# Altium project OFP_SCM_v1.5.PrjPcb (part 1 of 2)
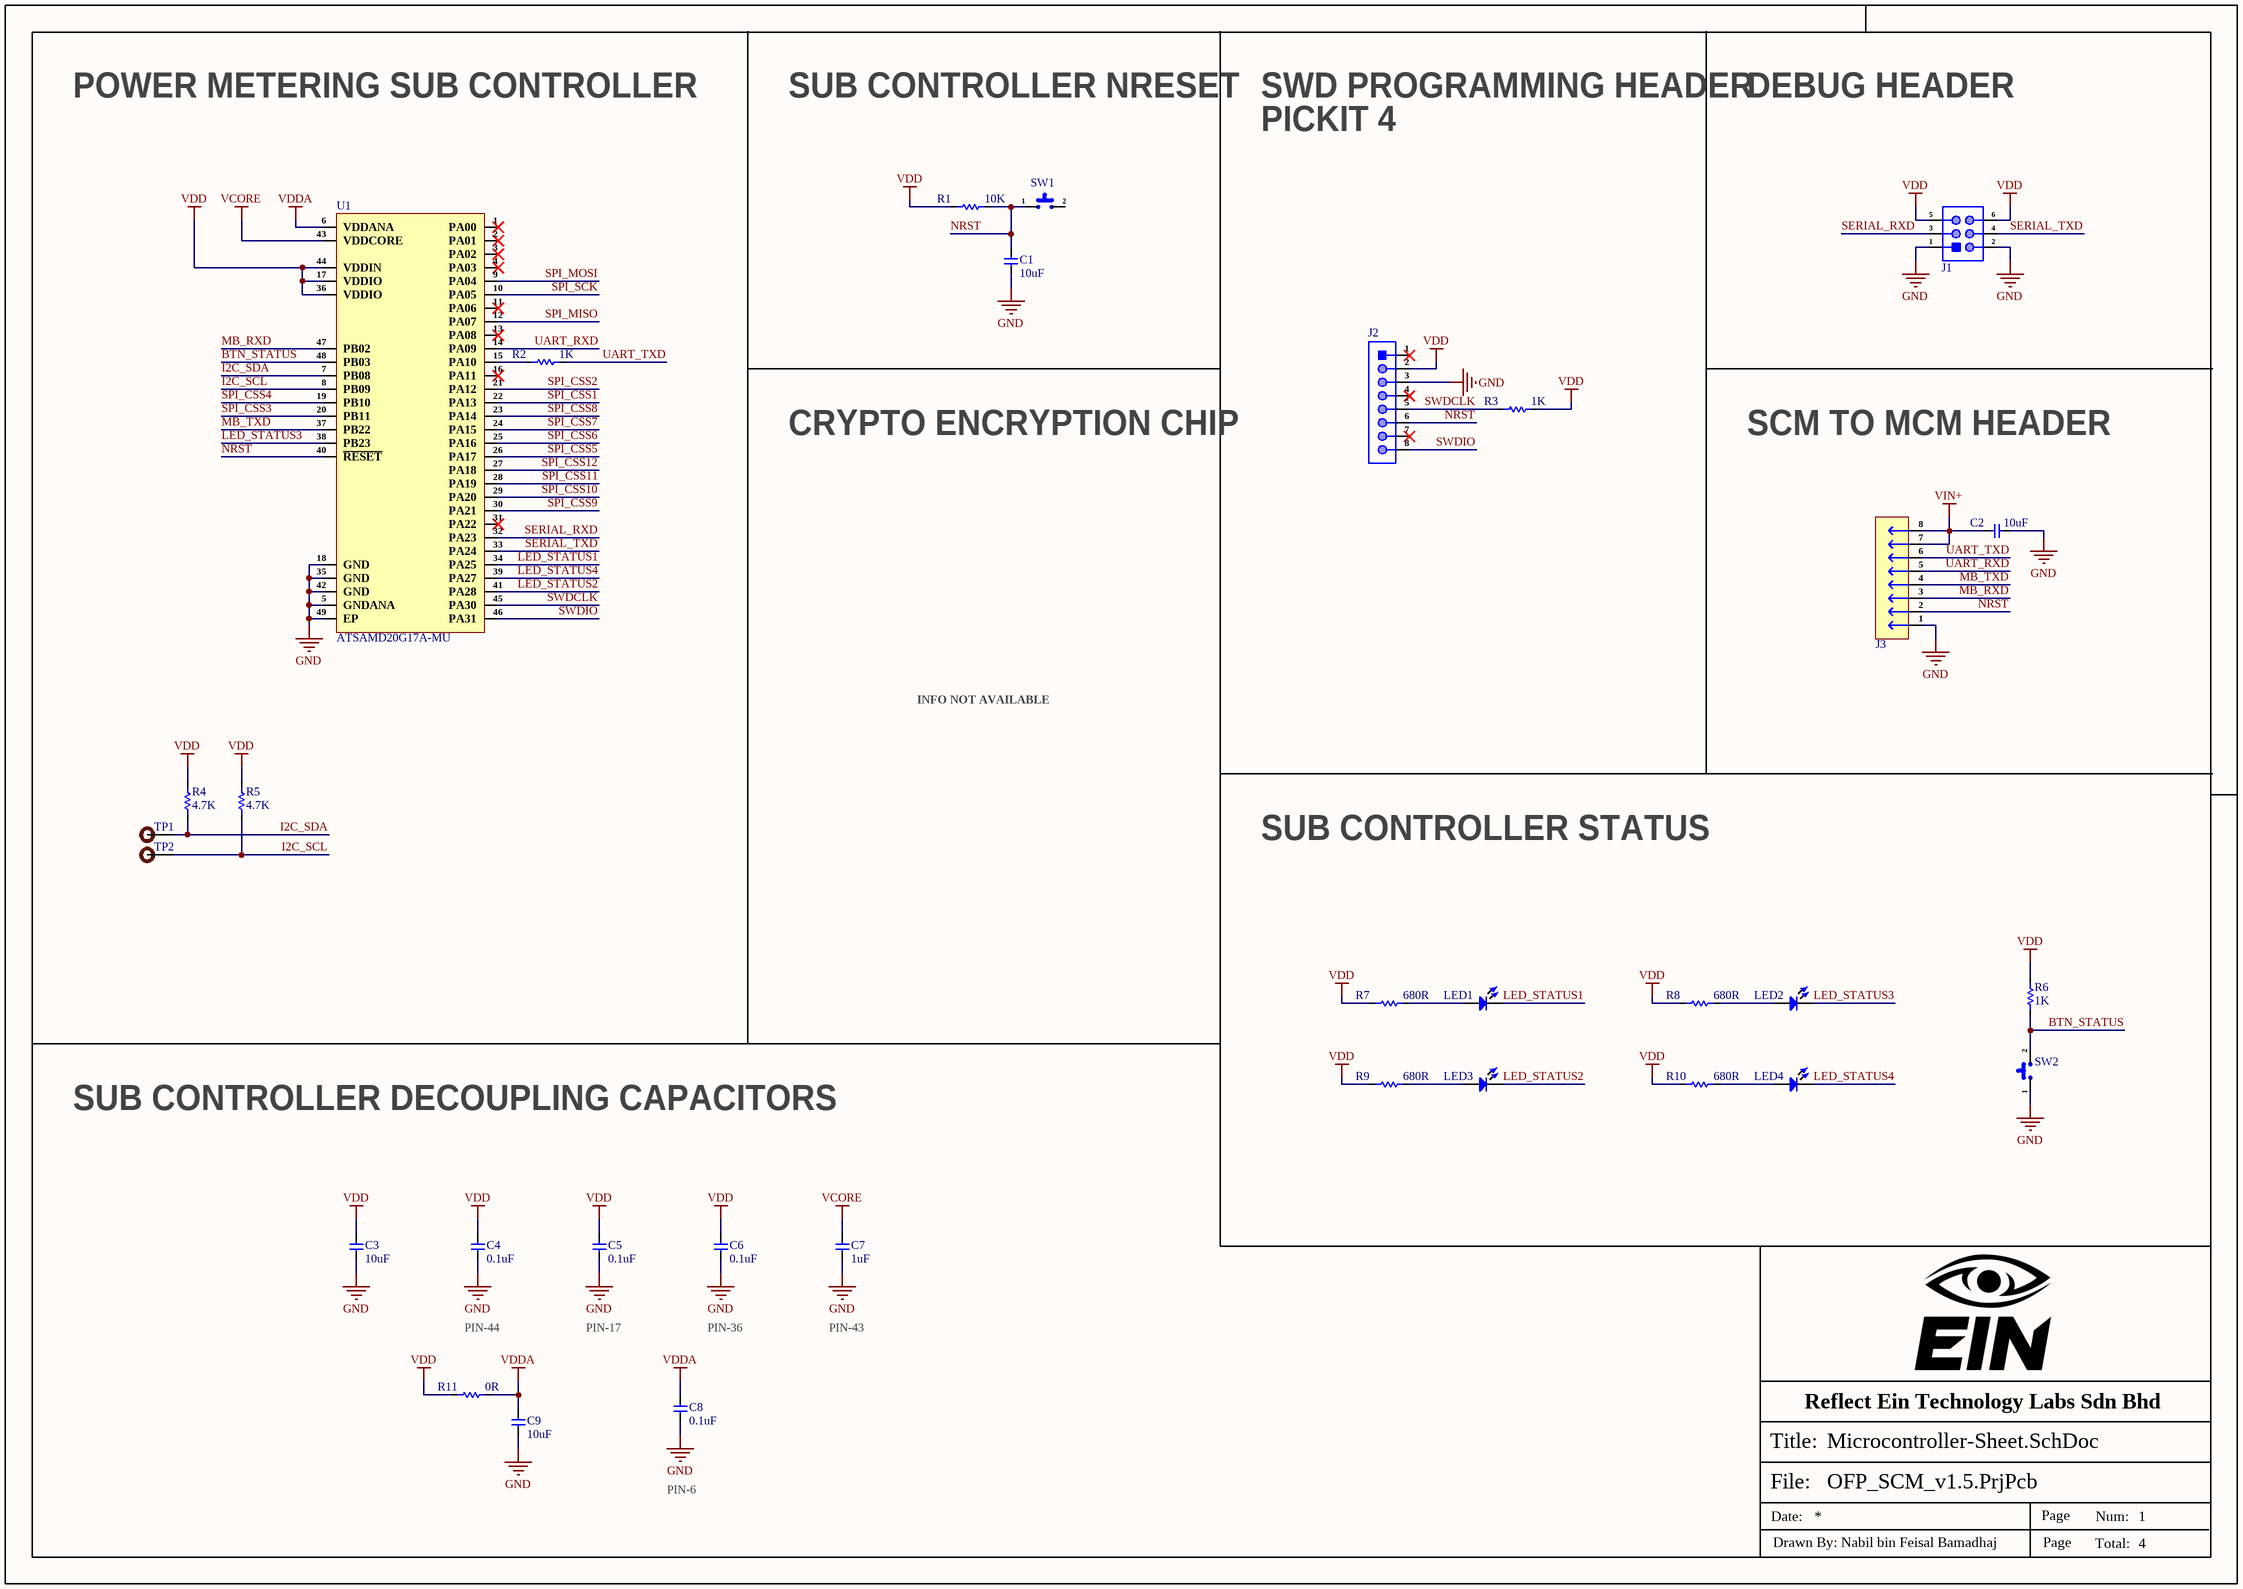
[diagram p0: Microcontroller-Sheet.SchDoc]
4 sheets, 90 parts. Net scope: global (net labels, ports and power ports of the same name join across sheets).
Board file: OFP_SCM_v1.5.PcbDoc
Sheets:
  Microcontroller-Sheet.SchDoc
  Power-Sheet.SchDoc
  Isolation-Sheet.SchDoc
  Board-Connectors.SchDoc

## Sheet Microcontroller-Sheet.SchDoc
size 420 x 297 mm; SheetNumber: 1; SheetTotal: 4

### Parts
C1  10uF  [Cap-0603]
C2  10uF  [Cap-0603]
C3  10uF  [Cap-0603]
C4  0.1uF  [Cap-0603]
C5  0.1uF  [Cap-0603]
C6  0.1uF  [Cap-0603]
C7  1uF  [Cap-0603]
C8  0.1uF  [Cap-0603]
C9  10uF  [Cap-0603]
J1  X6521WV-2x03H-C60D30  [X6521WV-2x03H-C60D30]  (value not drawn)
J2  X6511WV-08H-C60D30  [HDR 1x8 TH male]  (value not drawn)
J3  B8B-XH-A(LF)(SN)  [B8B-XH-A(LF)(SN)]  (value not drawn)
LED1  Blue  [LED-0603]  (value not drawn)
LED2  Blue  [LED-0603]  (value not drawn)
LED3  Blue  [LED-0603]  (value not drawn)
LED4  Blue  [LED-0603]  (value not drawn)
R1  10K  [Res-0603]
R2  1K  [Res-0603]
R3  1K  [Res-0603]
R4  4.7K  [Res-0603]
R5  4.7K  [Res-0603]
R6  1K  [Res-0603]
R7  680R  [Res-0603]
R8  680R  [Res-0603]
R9  680R  [Res-0603]
R10  680R  [Res-0603]
R11  0R  [Res-0603]
SW1  TS-1088-AR02016  [TS-1088-AR02016]  (value not drawn)
SW2  TS-1088-AR02016  [TS-1088-AR02016]  (value not drawn)
TP1  TEST POINT 0.5mm Dia  [Test-point - 0.5mm]  (value not drawn)  (no BOM)
TP2  TEST POINT 0.5mm Dia  [Test-point - 0.5mm]  (value not drawn)  (no BOM)
U1  ATSAMD20G17A-MU  [48-QFN (7x7)]

### Nets
GND: C1.1 C2.1 C3.1 C4.1 C5.1 C6.1 C7.1 C8.1 C9.1 J1.1 J1.2 J2.3 J3.1 SW2.1 U1.5(GNDANA) U1.18(GND) U1.35(GND) U1.42(GND) U1.49(EP)
VCORE: C7.2 U1.43(VDDCORE)
VDD: C3.2 C4.2 C5.2 C6.2 J1.5 J1.6 J2.2 R1.1 R3.2 R4.2 R5.2 R6.2 R7.2 R8.2 R9.2 R10.2 R11.1 U1.17(VDDIO) U1.36(VDDIO) U1.44(VDDIN)
VDDA: C8.2 C9.2 R11.2 U1.6(VDDANA)
VIN+: C2.2 J3.7 J3.8
BTN_STATUS: R6.1 SW2.2 U1.48(PB03)
I2C_SCL: R5.1 TP2.1 U1.8(PB09)
I2C_SDA: R4.1 TP1.1 U1.7(PB08)
LED_STATUS1: LED1.2 U1.34(PA25)
LED_STATUS2: LED3.2 U1.41(PA28)
LED_STATUS3: LED2.2 U1.38(PB23)
LED_STATUS4: LED4.2 U1.39(PA27)
MB_RXD: J3.3 U1.47(PB02)
MB_TXD: J3.4 U1.37(PB22)
NRST: C1.2 J2.6 J3.2 R1.2 SW1.1 U1.40(~{RESET})
SERIAL_RXD: J1.3 U1.32(PA23)
SERIAL_TXD: J1.4 U1.33(PA24)
SPI_CSS1: U1.22(PA13)
SPI_CSS2: U1.21(PA12)
SPI_CSS3: U1.20(PB11)
SPI_CSS4: U1.19(PB10)
SPI_CSS5: U1.26(PA17)
SPI_CSS6: U1.25(PA16)
SPI_CSS7: U1.24(PA15)
SPI_CSS8: U1.23(PA14)
SPI_CSS9: U1.30(PA21)
SPI_CSS10: U1.29(PA20)
SPI_CSS11: U1.28(PA19)
SPI_CSS12: U1.27(PA18)
SPI_MISO: U1.12(PA07)
SPI_MOSI: U1.9(PA04)
SPI_SCK: U1.10(PA05)
SWDCLK: J2.5 R3.1 U1.45(PA30)
SWDIO: J2.8 U1.46(PA31)
UART_RXD: J3.5 U1.14(PA09)
UART_TXD: J3.6 R2.2
NetLED1_1: LED1.1 R7.1
NetLED2_1: LED2.1 R8.1
NetLED3_1: LED3.1 R9.1
NetLED4_1: LED4.1 R10.1
NetR2_1: R2.1 U1.15(PA10)

Not connected (* = marked no-connect by the designer): J2 1* 4* 7*; SW1 2; U1 1(PA00)* 2(PA01)* 3(PA02)* 4(PA03)* 11(PA06)* 13(PA08)* 16(PA11)* 31(PA22)*

### Notes on the sheet
- POWER METERING SUB CONTROLLER
- SUB CONTROLLER NRESET
- SWD PROGRAMMING HEADER
- PICKIT 4
- DEBUG HEADER
- CRYPTO ENCRYPTION CHIP
- SCM TO MCM HEADER
- INFO NOT AVAILABLE
- SUB CONTROLLER STATUS
- SUB CONTROLLER DECOUPLING CAPACITORS
- PIN-44
- PIN-17
- PIN-36
- PIN-43
- PIN-6
- Reflect Ein Technology Labs Sdn Bhd
- File:
- Title:
- Date:
- Page
- Num:
- Total:
- Drawn By: Nabil bin Feisal Bamadhaj

### Library data of the parts
C1-C3 C9 = GRM188Z71A106KA73D: CAP CER 10UF 10V X7R 0603; Manufacturer: Murata; Item Type: Capacitor; Material: 4241ConductorMaterial; Tolerance: 10%; Supplier: Mouser; LCSC Part Number: C2959727; Manufacturer Part Number: GRM188Z71A106KA73D; RoHS: Yes; Stock: 390983; Pricing: 1=0.36, 10=0.155, 50=0.155, 100=0.104, 1000=0.094, 10000=0.065 (USD); Case/Package: 345Case; Min Operating Temperature: -55°C; Max Operating Temperature: 125°C; Value: 10uF; Voltage Rating: 10V; Length: 1.6mm; Width: 800um; Height: 1mm; Thickness: 800um; RoHS Compliant: Yes; ComponentLink1URL: https://datasheet.octopart.com/GRM188Z71A106KA73D-Murata-datasheet-165579666.pdf?src-supplier=TME; ComponentLink1Description: https://datasheet.octopart.com/GRM188Z71A106KA73D-Murata-datasheet-165579666.pdf?src-supplier=TME
C4-C6 C8 = GCJ188R71H104KA12D: CAP CER 0.1UF 50V X7R 0603; Manufacturer: Murata; Item Type: Capacitors; Material: 4241ConductorMaterial; Value: 100nF; Tolerance: 10%; Supplier: Mouser; LCSC Part Number: C161115; Manufacturer Part Number: GCJ188R71H104KA12D; RoHS: Yes; Stock: 342536; Pricing: 1=0.13, 10=0.056, 50=0.056, 100=0.036, 1000=0.032, 10000=0.02 (USD); Mounting Technology: Surface Mount; Case/Package: 0603; Case Code (Metric): 1608; Case Code (Imperial): 0603; Min Operating Temperature: -55°C; Max Operating Temperature: 125°C; Dielectric: X7R; Package Quantity: 1; Voltage Rating: 50V; Packaging: Tape and Reel; Voltage Rating (DC): 50V; Termination: SMD/SMT; Features: Soft Termination; Series: GCJ; Construction: Flat; Length: 1.6mm; Width: 0.031inch; Height: 0.8mm; Thickness: 0.035inch; Depth: 0.8mm; Ratings: AEC-Q200; Radiation Hardening: No; RoHS Compliant: Yes; Lead Free: 5697LeadFree; ComponentLink1URL: https://datasheet.ciiva.com/135/product-135604.pdf?src-supplier=Digikey; ComponentLink1Description: https://datasheet.ciiva.com/135/product-135604.pdf?src-supplier=Digikey; ComponentLink2URL: https://datasheet.ciiva.com/26889/getdatasheetpartid-369886-26889118.pdf?src-supplier=Verical; ComponentLink2Description: https://datasheet.ciiva.com/26889/getdatasheetpartid-369886-26889118.pdf?src-supplier=Verical; ComponentLink3URL: https://datasheet.ciiva.com/135/s0717e-135605.pdf?src-supplier=Digikey; ComponentLink3Description: https://datasheet.ciiva.com/135/s0717e-135605.pdf?src-supplier=Digikey; ComponentLink4URL: https://datasheet.ciiva.com/135/s0717e-135606.pdf?src-supplier=Digikey; ComponentLink4Description: https://datasheet.ciiva.com/135/s0717e-135606.pdf?src-supplier=Digikey; ComponentLink5URL: https://datasheet.ciiva.com/16440/c03e-16440425.pdf?src-supplier=Future+Electronics; ComponentLink5Description: https://datasheet.ciiva.com/16440/c03e-16440425.pdf?src-supplier=Future+Electronics
C7 = CC0603KRX7R9BB105: CAP CER 1UF 50V X7R 0603; Manufacturer: Yageo; Item Type: Capacitors; Material: 4241ConductorMaterial; Tolerance: 10%; Supplier: Rs; LCSC Part Number: C559769; Manufacturer Part Number: CC0603KRX7R9BB105; RoHS: Yes; Stock: 950; Mounting Technology: Surface Mount; Case/Package: 0603; Case Code (Metric): 1608; Case Code (Imperial): 0603; Weight: 7.1E-05oz; Min Operating Temperature: -55°C; Max Operating Temperature: 125°C; Value: 1uF; Dielectric: X7R; Packaging: Tape and Reel; Voltage Rating: 50V; Termination: SMD/SMT; Voltage Rating (DC): 50V; Package Quantity: 4000; Series: CC; Length: 0.063inch; Width: 0.031inch; Height: 900um; Thickness: 0.035inch; Lead Free: Lead Free; RoHS Compliant: Yes; Halogen Free: 5694HalogenFree; ComponentLink1URL: http://www.mouser.com/ds/2/447/Yageo_UPY-GP_NP0_16V-to-50V_9-358835.pdf?src-supplier=Mouser; ComponentLink1Description: http://www.mouser.com/ds/2/447/Yageo_UPY-GP_NP0_16V-to-50V_9-358835.pdf?src-supplier=Mouser; ComponentLink2URL: http://www.yageo.com/documents/recent/UPY-GPHC_X7R_6.3V-to-50V_18.pdf?src-supplier=Digikey; ComponentLink2Description: http://www.yageo.com/documents/recent/UPY-GPHC_X7R_6.3V-to-50V_18.pdf?src-supplier=Digikey; ComponentLink3URL: https://datasheet.octopart.com/CC0603KRX7R9BB105-Yageo-datasheet-137700082.pdf?src-supplier=Future+Electronics; ComponentLink3Description: https://datasheet.octopart.com/CC0603KRX7R9BB105-Yageo-datasheet-137700082.pdf?src-supplier=Future+Electronics
J1 = X6521WV-2x03H-C60D30: Gold 250V 3A Policy 2.5mm 6P -40℃~+105℃ 2.54mm Double Row Black Brass 2x3P 2.54mm Plugin,P=2.54mm Pin Headers ROHS; Manufacturer: XKB; Item Type: Male Pin Header; Manufacturer Part Number: X6521WV-2x03H-C60D30; Package: Plugin,P=2.54mm; LCSC Part Number: C706893; ComponentLink1Description: LCSC; ComponentLink1URL: https://www.lcsc.com/product-detail/Pin-Headers_XKB-Connection-X6521WV-2x03H-C60D30_C706893.html
J2 = X6511WV-08H-C60D30: Gold 250V 3A Square Pins 2.5mm 8P 260℃ 6mm -40℃~+105℃ 3mm 2.54mm Plugin Black Brass 2.54mm 1x8P Plugin,P=2.54mm Pin Headers ROHS; Manufacturer: XKB; Item Type: Male Header; Manufacturer Part Number: X6511WV-08H-C60D30; Package: Plugin,P=2.54mm; LCSC Part Number: C706880; ComponentLink1Description: LCSC; ComponentLink1URL: https://www.lcsc.com/product-detail/Pin-Headers_XKB-Connection-X6511WV-08H-C60D30_C706880.html
J3 = B8B-XH-A(LF)(SN): CONN HEADER VERT 8POS 2.5MM; Manufacturer: JST; Item Type: Wire to Board Connector; Contact Resistance: 20mR; Max Current Rating: 3A; Voltage Rating (AC): 250V; Number of Positions: 8; Insulation Resistance: 1GR; Wire/Cable Gauge: 22AWG; Supplier: Rs; LCSC Part Number: C157972; Manufacturer Part Number: B8B-XH-A(LF)(SN); RoHS: Yes; Stock: 14940; Mounting Technology: Through Hole; Contact Material: Brass; Contact Plating: Tin,Lead,Copper; Color: Natural; Housing Color: White; Housing Material: Polyamide; Weight: 28.349523g; Min Operating Temperature: -25°C; Max Operating Temperature: 85°C; Number of Rows: 1; Current Rating: 3A; Voltage Rating: 250V; Packaging: Bulk; Termination: Press-Fit; Fastening Type: Detent; Max Voltage Rating (AC): 250V; Number of Contacts: 8; Orientation: Straight; Series: XH; Contact Type: Male Pin; Length: 22.4mm; Lead Pitch: 2.5mm; Pitch: 2.5mm; Depth: 5.75mm; Reach SVHC Compliant: No; Lead Free: 5697LeadFree; ComponentLink1URL: https://datasheet.ciiva.com/11747/0900766b80826540-11747580.pdf?src-supplier=Rs; ComponentLink1Description: https://datasheet.ciiva.com/11747/0900766b80826540-11747580.pdf?src-supplier=Rs; ComponentLink2URL: https://datasheet.ciiva.com/26894/getdatasheetpartid-440408-26894817.pdf?src-supplier=Verical; ComponentLink2Description: https://datasheet.ciiva.com/26894/getdatasheetpartid-440408-26894817.pdf?src-supplier=Verical
LED1-LED4 = NCD0603B3: blue 0603 Light Emitting Diodes (LED) ROHS; Manufacturer: Foshan NationStar Optoelectronics; Manufacturer Part Number: NCD0603B3; Package: 0603; LCSC Part Number: C158101; Item Type: LED; ComponentLink1Description: LCSC; ComponentLink1URL: https://www.lcsc.com/product-detail/Light-Emitting-Diodes-LED_Foshan-NationStar-Optoelectronics-NCD0603B3_C158101.html
R1 = RC0603FR-0710KL: RES SMD 10K Ohm 1% 1/10W 0603; Manufacturer: Yageo; Resistance: 10kR; Temperature Coefficient: 100ppm/°C; Voltage Rating (DC): 50V; Power Rating: 100mW; Voltage Rating: 75V; Item Type: Resistor; Supplier 1: Digi-Key; Manufacturer Part Number: RC0603FR-0710KL; RoHS: Yes; Category: Chip SMD Resistors; Stock 1: 25249139; Pricing 1: 1=0.10000, 10=0.02400, 100=0.00970, 1000=0.00436, 2500=0.00378 (USD); Case/Package: 0603; Number of Pins: 2; Case Code (Imperial): 0603; Case Code (Metric): 1608; Weight: 7.1E-05oz; Size Code: 0603; Min Operating Temperature: -55°C; Max Operating Temperature: 155°C; Tolerance: 1%; Resistor Type: Thick Film; Packaging: Tape and Reel; Termination: SMD/SMT; Features: Moisture Resistant; Series: RC; Max Power Dissipation: 100mW; Number of Terminations: 2; Resistance Tolerance: 1%; Construction: Rectangular; Length: 1.6mm; Width: 0.8mm; Height: 0.45mm; Depth: 0.8mm; Lead Pitch: 0.3mm; REACH SVHC: Unknown; Lead Free: Lead Free; Military Standard: Not; RoHS Compliant: Yes; ComponentLink1URL: https://datasheet.ciiva.com/7660/38590-7660789.pdf?src-supplier=Element14; ComponentLink1Description: https://datasheet.ciiva.com/7660/38590-7660789.pdf?src-supplier=Element14; ComponentLink2URL: https://datasheet.ciiva.com/7983/443971-7983596.pdf?src-supplier=Element14; ComponentLink2Description: https://datasheet.ciiva.com/7983/443971-7983596.pdf?src-supplier=Element14; ComponentLink3URL: https://datasheet.ciiva.com/22747/443971-22747519.pdf?src-supplier=Element14; ComponentLink3Description: https://datasheet.ciiva.com/22747/443971-22747519.pdf?src-supplier=Element14; ComponentLink4URL: https://datasheet.ciiva.com/46440/1868787-46440891.pdf?src-supplier=Element14; ComponentLink4Description: https://datasheet.ciiva.com/46440/1868787-46440891.pdf?src-supplier=Element14; ComponentLink5URL: https://datasheet.ciiva.com/7746/1738695-7746239.pdf?src-supplier=Element14; ComponentLink5Description: https://datasheet.ciiva.com/7746/1738695-7746239.pdf?src-supplier=Element14; ComponentLink6URL: https://datasheet.ciiva.com/15189/getdatasheetpartid-409289-15189591.pdf?src-supplier=Verical; ComponentLink6Description: https://datasheet.ciiva.com/15189/getdatasheetpartid-409289-15189591.pdf?src-supplier=Verical; Supplier Part Number 1: 311-10.0KHRCT-ND; LCSC Part Number: C98220
R2 R3 R6 = RC0603FR-071KL: RES SMD 1K OHM 1% 1/10W 0603; Manufacturer: Yageo; Resistance: 1kR; Temperature Coefficient: 100ppm/°C; Power Rating: 100mW; Voltage Rating: 50V; Item type: Resistor; ComponentLink1URL: https://www.verical.com/server-webapp/html/getDatasheet?partID=409289&src-supplier=Verical; ComponentLink1Description: https://www.verical.com/server-webapp/html/getDatasheet?partID=409289&src-supplier=Verical; Supplier 1: Digi-Key; Manufacturer Part Number: RC0603FR-071KL; Stock 1: 21472395; Pricing 1: 1=0.1, 10=0.023, 100=0.0094, 1000=0.0042, 2500=0.0037 (USD); Case/Package: 0603; Contact Plating: Tin,Matte; Case Code (Imperial): 0603; Case Code (Metric): 1608; Min Operating Temperature: -55°C; Max Operating Temperature: 155°C; Tolerance: 1%; Composition: Thick Film; Packaging: Tape and Reel; Termination: SMD/SMT; Military Standard: Not; Length: 1.6mm; Height: 0.45mm; Depth: 0.8mm; Radiation Hardening: No; REACH SVHC: No SVHC; Lead Free: Lead Free; ComponentLink2URL: http://documents.rs-components.com/techlib://itc_doclist_GB.htm?stockno=5048928&src-supplier=RSComponents; ComponentLink2Description: http://documents.rs-components.com/techlib://itc_doclist_GB.htm?stockno=5048928&src-supplier=RSComponents; ComponentLink3URL: http://www.yageo.com/documents/recent/PYu-RC0603_51_RoHS_L_4.pdf?src-supplier=Avnet+Europe; ComponentLink3Description: http://www.yageo.com/documents/recent/PYu-RC0603_51_RoHS_L_4.pdf?src-supplier=Avnet+Europe; ComponentLink4URL: http://www.farnell.com/datasheets/2167052.pdf?src-supplier=Element14; ComponentLink4Description: http://www.farnell.com/datasheets/2167052.pdf?src-supplier=Element14; ComponentLink5URL: http://www.farnell.com/datasheets/1868787.pdf?src-supplier=Element14; ComponentLink5Description: http://www.farnell.com/datasheets/1868787.pdf?src-supplier=Element14; ComponentLink6URL: http://www.yageo.com/documents/recent/PYu-RC_Group_51_RoHS_L_2.pdf?src-supplier=Avnet; ComponentLink6Description: http://www.yageo.com/documents/recent/PYu-RC_Group_51_RoHS_L_2.pdf?src-supplier=Avnet; ComponentLink7URL: https://www.verical.com/server-webapp/html/getDatasheet?partID=404327&src-supplier=Verical; ComponentLink7Description: https://www.verical.com/server-webapp/html/getDatasheet?partID=404327&src-supplier=Verical; ComponentLink8URL: http://www.farnell.com/datasheets/443971.pdf?src-supplier=Element14; ComponentLink8Description: http://www.farnell.com/datasheets/443971.pdf?src-supplier=Element14; Supplier Part Number 1: 311-1.00KHRDKR-ND; LCSC Part Number: C22548
R4 R5 = RC0603FR-074K7L: RES SMD 4.7K OHM 1% 1/10W 0603; Manufacturer: Yageo; Item Type: Resistor; Manufacturer Part Number: RC0603FR-074K7L; Package: 0603; ComponentLink7Description: LCSC; ComponentLink7URL: https://www.lcsc.com/product-detail/Chip-Resistor-Surface-Mount_YAGEO-RC0603FR-074K7L_C99782.html; LCSC Part Number: C99782
R7-R10 = RC0603FR-07680RL: RES SMD 680 OHM 1% 1/10W 0603; Manufacturer: Yageo; Item Type: Resistor; Manufacturer Part Number: RC0603FR-07680RL; Package: 0603; ComponentLink4URL: https://www.lcsc.com/product-detail/Chip-Resistor-Surface-Mount_YAGEO-RC0603FR-07680RL_C112310.html; ComponentLink4Description: LCSC; LCSC Part Number: C112310
R11 = RC0603FR-070RL: RES SMD 0R, 1%, 0.1W, 0603; Manufacturer: Yageo; Item Type: Resistor; Manufacturer Part Number: RC0603FR-070RL; Package: 0603; LCSC Part Number: C100044; ComponentLink9Description: LCSC; ComponentLink9URL: https://www.lcsc.com/product-detail/Chip-Resistor-Surface-Mount_YAGEO-RC0603FR-070RL_C100044.html
SW1 SW2 = TS-1088-AR02016: Without bracket 50mA 4mm 100000 Times 12V 160gf 3mm 2mm Round Button Standing paste SPST SMD Tactile Switches ROHS; Manufacturer: XUNPU; Manufacturer Part Number: TS-1088-AR02016; Package: SMD; LCSC Part Number: C720477; Item Type: Tactile Switch; ComponentLink1Description: LCSC; ComponentLink1URL: https://www.lcsc.com/product-detail/Tactile-Switches_XUNPU-TS-1088-AR02016_C720477.html?s_z=n_TS-1088-AR02016
TP1 TP2 = TEST POINT 0.5mm Dia: Test Point ON; Item Type: Test Point; Manufacturer Part Number: TEST POINT 0.5mm Dia
U1 = ATSAMD20G17A-MU: IC MCU 32BIT 128KB FLASH 48QFN; Manufacturer: Microchip; Supplier: Arrow Electronics; LCSC Part Number: C1343519; Manufacturer Part Number: ATSAMD20G17A-MU; RoHS: Yes; Item Type: IC; Pricing: 416=2.217 (USD); ComponentLink1URL: https://datasheet.ciiva.com/29989/atmel-42129-sam-d20-datasheet-29989946.pdf?src-supplier=Avnet; ComponentLink1Description: https://datasheet.ciiva.com/29989/atmel-42129-sam-d20-datasheet-29989946.pdf?src-supplier=Avnet

## Sheet Power-Sheet.SchDoc
size 420 x 297 mm; SheetNumber: 2; SheetTotal: 4
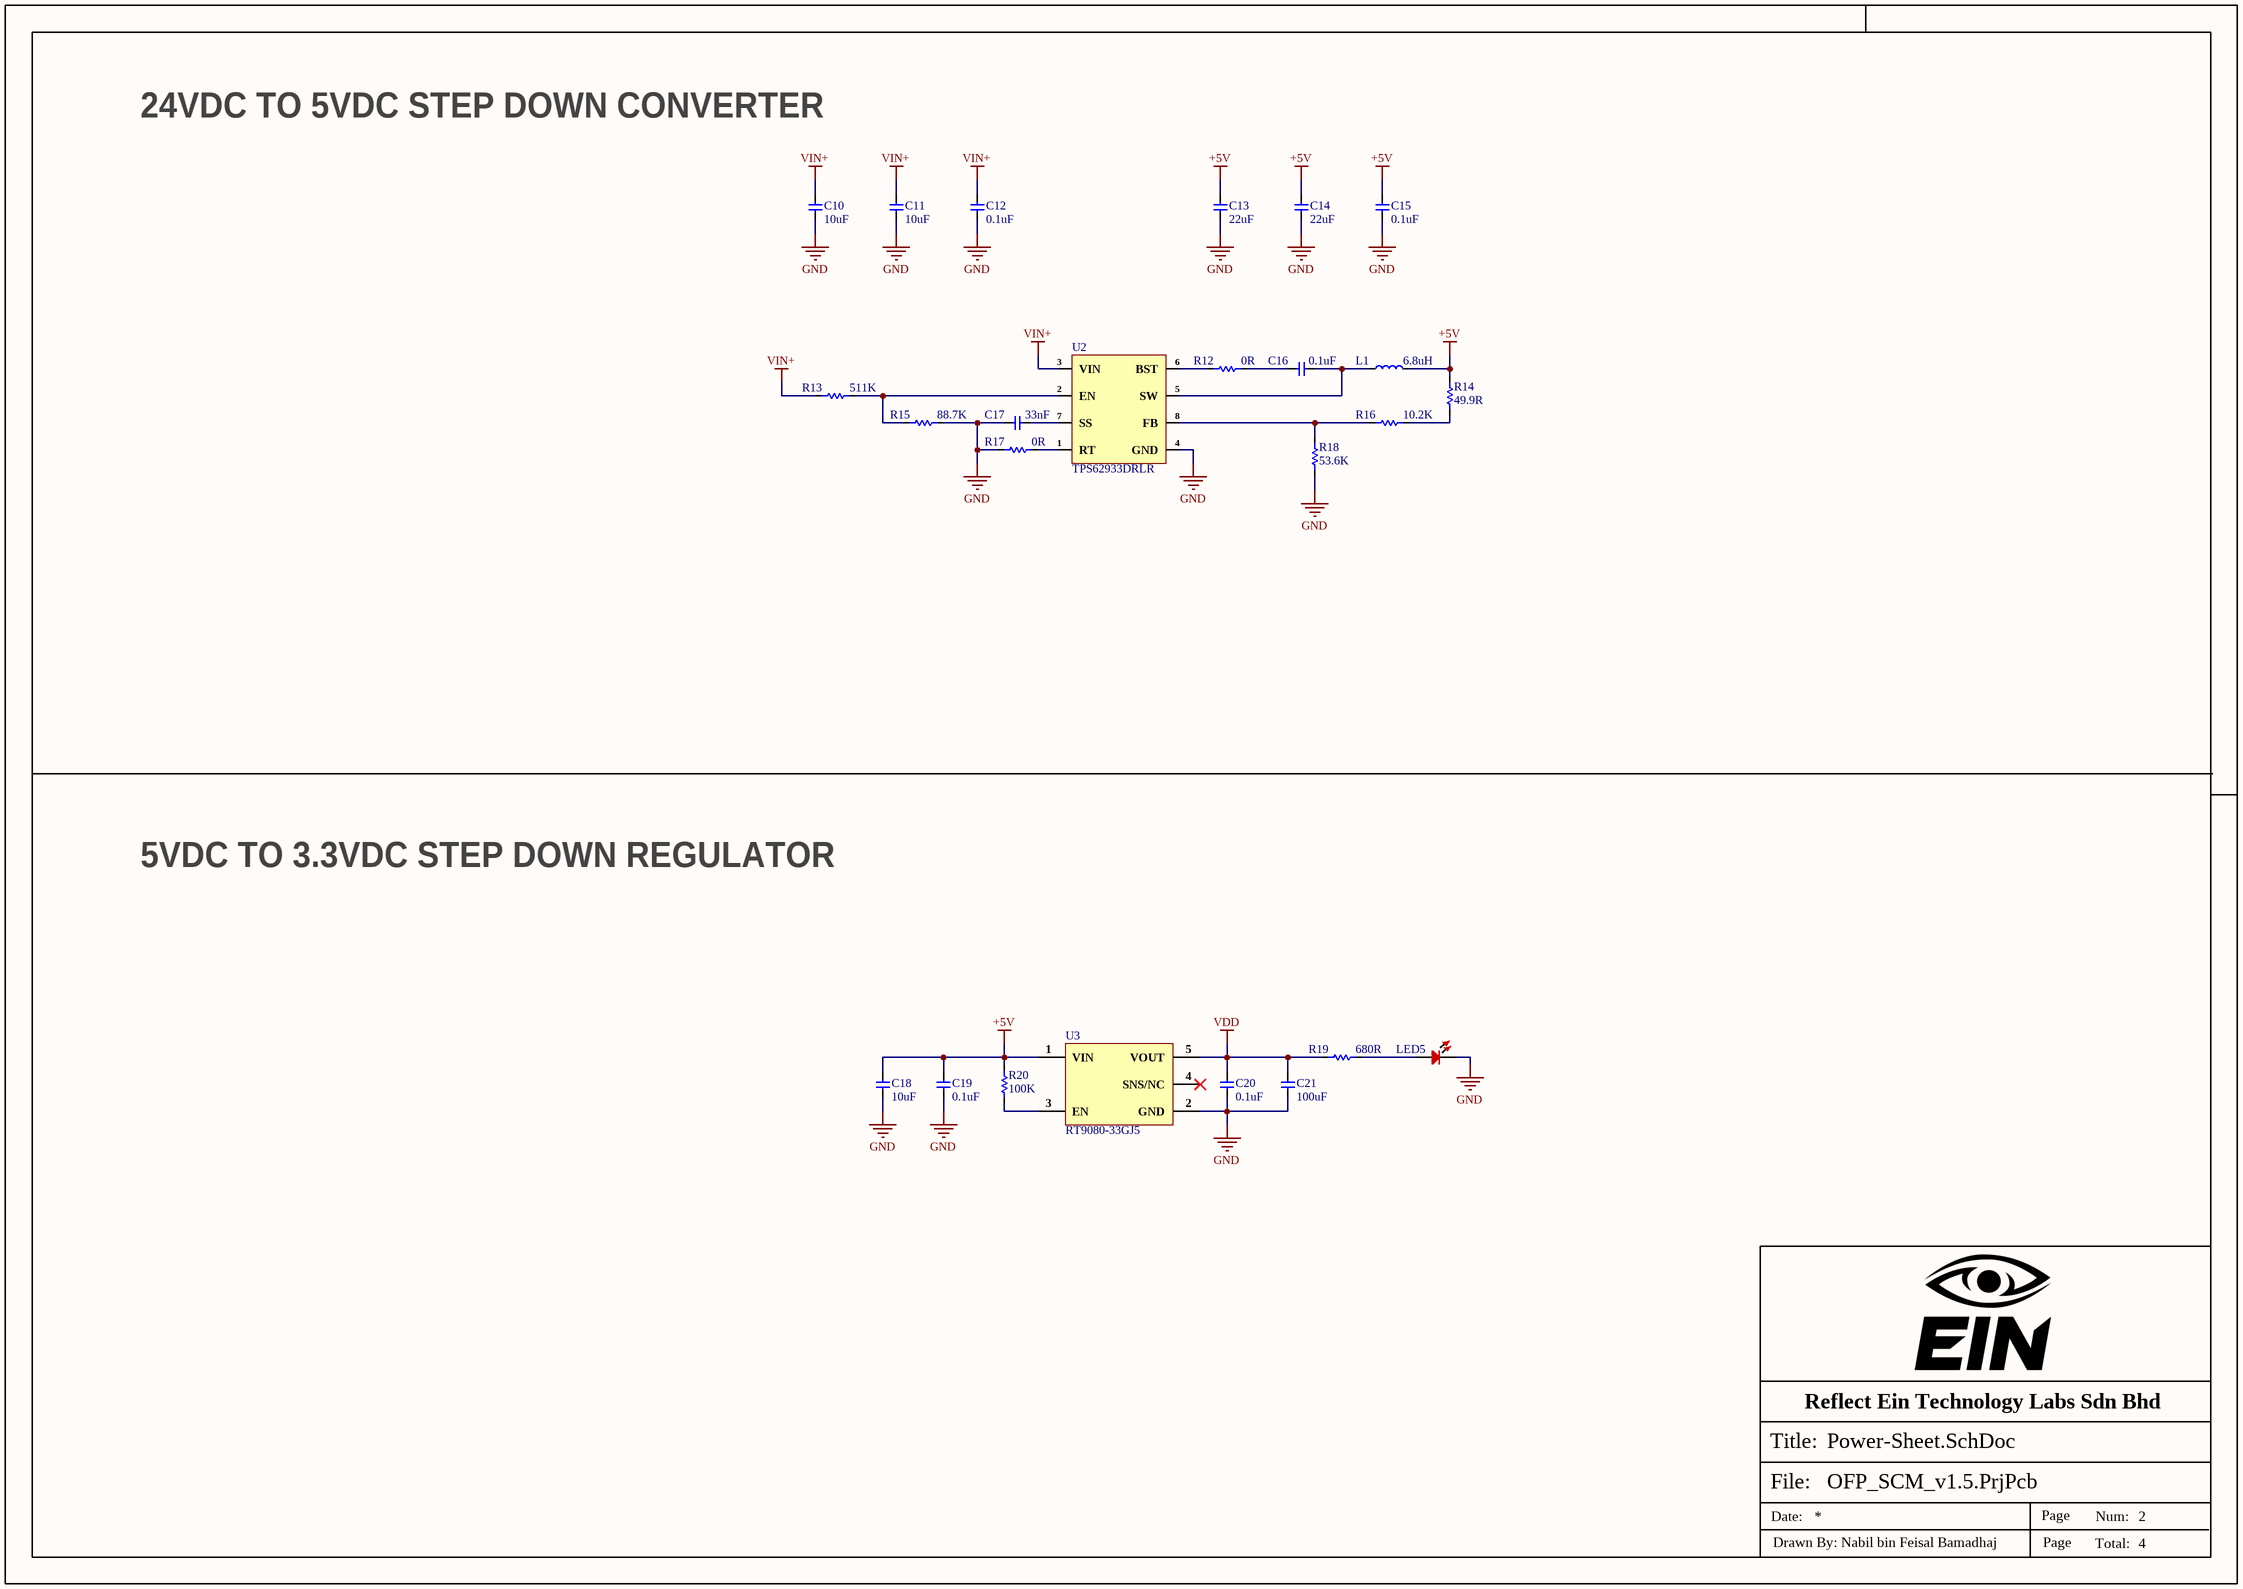
[diagram p1: Power-Sheet.SchDoc]

### Parts
C10  10uF  [Cap-1210]
C11  10uF  [Cap-1210]
C12  0.1uF  [Cap-0603]
C13  22uF  [Cap-0805]
C14  22uF  [Cap-0805]
C15  0.1uF  [Cap-0603]
C16  0.1uF  [Cap-0603]
C17  33nF  [Cap-0603]
C18  10uF  [Cap-0603]
C19  0.1uF  [Cap-0603]
C20  0.1uF  [Cap-0603]
C21  100uF  [Cap-1210]
L1  6.8uH  [ETQP3M6R8KVN]
LED5  RED  [LED-0603]  (value not drawn)
R12  0R  [Res-0603]
R13  511K  [Res-0603]
R14  49.9R  [Res-0603]
R15  88.7K  [Res-0603]
R16  10.2K  [Res-0603]
R17  0R  [Res-0603]
R18  53.6K  [Res-0603]
R19  680R  [Res-0603]
R20  100K  [Res-0603]
U2  TPS62933DRLR  [SOT-583]
U3  RT9080-33GJ5  [TSOT-23-5]

### Nets
+5V: C13.2 C14.2 C15.2 C18.2 C19.2 L1.2 R14.2 R20.2 U3.1(VIN)
GND: C10.1 C11.1 C12.1 C13.1 C14.1 C15.1 C17.1 C18.1 C19.1 C20.1 C21.1 LED5.2 R15.2 R17.1 R18.1 U2.4(GND) U3.2(GND)
VDD: C20.2 C21.2 R19.2 U3.5(VOUT)
VIN+: C10.2 C11.2 C12.2 R13.1 U2.3(VIN)
NetC16_1: C16.1 L1.1 U2.5(SW)
NetC16_2: C16.2 R12.2
NetC17_2: C17.2 U2.7(SS)
NetLED5_1: LED5.1 R19.1
NetR12_1: R12.1 U2.6(BST)
NetR13_2: R13.2 R15.1 U2.2(EN)
NetR14_1: R14.1 R16.2
NetR16_1: R16.1 R18.2 U2.8(FB)
NetR17_2: R17.2 U2.1(RT)
NetR20_1: R20.1 U3.3(EN)

Not connected (* = marked no-connect by the designer): U3 4(SNS/NC)*

### Notes on the sheet
- 24VDC TO 5VDC STEP DOWN CONVERTER
- 5VDC TO 3.3VDC STEP DOWN REGULATOR
- Reflect Ein Technology Labs Sdn Bhd
- File:
- Title:
- Date:
- Page
- Num:
- Total:
- Drawn By: Nabil bin Feisal Bamadhaj

### Library data of the parts
C10 C11 = GRM32ER71H106KA12L: CAP CER 10UF 50V X7R 1210; Manufacturer: Murata; Item Type: Capacitors; Supplier: Future Electronics; LCSC Part Number: C77102; Manufacturer Part Number: GRM32ER71H106KA12L; RoHS: Yes; Stock: 960000; Pricing: 1000=0.325, 2000=0.32, 3000=0.315, 4000=0.315, 5000=0.305 (USD); Lead Free: 5697LeadFree; RoHS Compliant: 5897YesNo; ComponentLink1URL: https://datasheet.ciiva.com/16497/product-16497010.pdf?src-supplier=Future+Electronics; ComponentLink1Description: https://datasheet.ciiva.com/16497/product-16497010.pdf?src-supplier=Future+Electronics; ComponentLink2URL: https://datasheet.ciiva.com/3777/4286grm32er71h106ka1223-3777306.pdf?src-supplier=Arrow+Electronics; ComponentLink2Description: https://datasheet.ciiva.com/3777/4286grm32er71h106ka1223-3777306.pdf?src-supplier=Arrow+Electronics; ComponentLink3URL: https://datasheet.ciiva.com/11789/0900766b80ef921d-11789081.pdf?src-supplier=Rs; ComponentLink3Description: https://datasheet.ciiva.com/11789/0900766b80ef921d-11789081.pdf?src-supplier=Rs; ComponentLink4URL: https://datasheet.ciiva.com/11607/c02e-11607596.pdf?src-supplier=Avnet; ComponentLink4Description: https://datasheet.ciiva.com/11607/c02e-11607596.pdf?src-supplier=Avnet; ComponentLink5URL: https://datasheet.ciiva.com/6270/partnumbering-e-01-6270167.pdf?src-supplier=Digikey; ComponentLink5Description: https://datasheet.ciiva.com/6270/partnumbering-e-01-6270167.pdf?src-supplier=Digikey; ComponentLink6URL: https://datasheet.ciiva.com/6270/partnumbering-e-01-6270168.pdf?src-supplier=Digikey; ComponentLink6Description: https://datasheet.ciiva.com/6270/partnumbering-e-01-6270168.pdf?src-supplier=Digikey; ComponentLink7URL: https://datasheet.ciiva.com/6270/partnumbering-e-01-6270169.pdf?src-supplier=Digikey; ComponentLink7Description: https://datasheet.ciiva.com/6270/partnumbering-e-01-6270169.pdf?src-supplier=Digikey; ComponentLink8URL: https://datasheet.ciiva.com/46441/1754714-46441340.pdf?src-supplier=Element14; ComponentLink8Description: https://datasheet.ciiva.com/46441/1754714-46441340.pdf?src-supplier=Element14
C12 C15 C16 C19 C20 = GCJ188R71H104KA12D: as C4 on sheet Microcontroller-Sheet; Supplier: Mouser; LCSC Part Number: C161115; Manufacturer Part Number: GCJ188R71H104KA12D; RoHS: Yes; Stock: 342536; Pricing: 1=0.13, 10=0.056, 50=0.056, 100=0.036, 1000=0.032, 10000=0.02 (USD); Mounting Technology: Surface Mount; Case/Package: 0603; Case Code (Metric): 1608; Case Code (Imperial): 0603; Min Operating Temperature: -55°C; Max Operating Temperature: 125°C; Dielectric: X7R; Package Quantity: 1; Voltage Rating: 50V; Packaging: Tape and Reel; Voltage Rating (DC): 50V; Termination: SMD/SMT; Features: Soft Termination; Series: GCJ; Construction: Flat; Length: 1.6mm; Width: 0.031inch; Height: 0.8mm; Thickness: 0.035inch; Depth: 0.8mm; Ratings: AEC-Q200; Radiation Hardening: No; RoHS Compliant: Yes; Lead Free: 5697LeadFree; ComponentLink1URL: https://datasheet.ciiva.com/135/product-135604.pdf?src-supplier=Digikey; ComponentLink1Description: https://datasheet.ciiva.com/135/product-135604.pdf?src-supplier=Digikey; ComponentLink2URL: https://datasheet.ciiva.com/26889/getdatasheetpartid-369886-26889118.pdf?src-supplier=Verical; ComponentLink2Description: https://datasheet.ciiva.com/26889/getdatasheetpartid-369886-26889118.pdf?src-supplier=Verical; ComponentLink3URL: https://datasheet.ciiva.com/135/s0717e-135605.pdf?src-supplier=Digikey; ComponentLink3Description: https://datasheet.ciiva.com/135/s0717e-135605.pdf?src-supplier=Digikey; ComponentLink4URL: https://datasheet.ciiva.com/135/s0717e-135606.pdf?src-supplier=Digikey; ComponentLink4Description: https://datasheet.ciiva.com/135/s0717e-135606.pdf?src-supplier=Digikey; ComponentLink5URL: https://datasheet.ciiva.com/16440/c03e-16440425.pdf?src-supplier=Future+Electronics; ComponentLink5Description: https://datasheet.ciiva.com/16440/c03e-16440425.pdf?src-supplier=Future+Electronics
C13 C14 = GRM21BZ71A226ME15L: CAP CER 22UF 10V X7R 0805; Manufacturer: Murata; Material: 4241ConductorMaterial; Tolerance: 20%; Item Type: Capacitor; Supplier: Digi-Key; Supplier Part Number: 490-GRM21BZ71A226ME15LCT-ND; Manufacturer Part Number: GRM21BZ71A226ME15L; RoHS: Yes; Category: Ceramic Capacitors; Stock: 49126; Pricing: 1=0.39, 10=0.259, 50=0.191, 100=0.1556, 500=0.12282, 1000=0.10372 (USD); Package: 0805; Min Operating Temperature: -55°C; Max Operating Temperature: 125°C; Value: 22uF; Voltage Rating: 10V; Length: 2mm; Width: 1.25mm; Height: 1.45mm; Thickness: 1.25mm; ComponentLink1URL: https://datasheet.octopart.com/GRM21BZ71A226ME15L-Murata-datasheet-165579666.pdf?src-supplier=TME; ComponentLink1Description: https://datasheet.octopart.com/GRM21BZ71A226ME15L-Murata-datasheet-165579666.pdf?src-supplier=TME; LCSC Part Number: C907991; ComponentLink2Description: LCSC; ComponentLink2URL: https://www.lcsc.com/product-detail/Multilayer-Ceramic-Capacitors-MLCC-SMD-SMT_Murata-Electronics-GRM21BZ71A226ME15L_C907991.html
C17 = GCJ188R71H333KA12D: CAP CER 0.033UF 50V X7R 0603; Manufacturer: Murata; Item Type: Capacitors; Tolerance: 10%; Supplier: Mouser; LCSC Part Number: C2173059; Manufacturer Part Number: GCJ188R71H333KA12D; RoHS: Yes; Stock: 15481; Pricing: 1=0.18, 10=0.072, 50=0.072, 100=0.047, 1000=0.039, 10000=0.027 (USD); Mounting Technology: Surface Mount; Case/Package: 0603; Case Code (Imperial): 0603; Case Code (Metric): 1608; Min Operating Temperature: -55°C; Max Operating Temperature: 125°C; Packaging: Tape and Reel; Value: 33nF; Package Quantity: 1; Voltage Rating: 50V; Dielectric: X7R; Voltage Rating (DC): 50V; Termination: SMD/SMT; Features: Soft Termination; Series: GCJ; Length: 1.6mm; Width: 0.031inch; Thickness: 0.031inch; Depth: 0.8mm; Ratings: AEC-Q200; Lead Free: Lead Free; RoHS Compliant: Yes; ComponentLink1URL: https://datasheet.ciiva.com/168/product-168891.pdf?src-supplier=Digikey; ComponentLink1Description: https://datasheet.ciiva.com/168/product-168891.pdf?src-supplier=Digikey; ComponentLink2URL: https://datasheet.ciiva.com/168/s0717e-168892.pdf?src-supplier=Digikey; ComponentLink2Description: https://datasheet.ciiva.com/168/s0717e-168892.pdf?src-supplier=Digikey; ComponentLink3URL: https://datasheet.ciiva.com/168/s0717e-168893.pdf?src-supplier=Digikey; ComponentLink3Description: https://datasheet.ciiva.com/168/s0717e-168893.pdf?src-supplier=Digikey
C18 = GRM188Z71A106KA73D: as C1 on sheet Microcontroller-Sheet; Supplier: Mouser; LCSC Part Number: C2959727; Manufacturer Part Number: GRM188Z71A106KA73D; RoHS: Yes; Stock: 390983; Pricing: 1=0.36, 10=0.155, 50=0.155, 100=0.104, 1000=0.094, 10000=0.065 (USD); Case/Package: 345Case; Min Operating Temperature: -55°C; Max Operating Temperature: 125°C; Value: 10uF; Voltage Rating: 10V; Length: 1.6mm; Width: 800um; Height: 1mm; Thickness: 800um; RoHS Compliant: Yes; ComponentLink1URL: https://datasheet.octopart.com/GRM188Z71A106KA73D-Murata-datasheet-165579666.pdf?src-supplier=TME; ComponentLink1Description: https://datasheet.octopart.com/GRM188Z71A106KA73D-Murata-datasheet-165579666.pdf?src-supplier=TME
C21 = CC1210MKX5R5BB107: CAP CER 100UF 6.3V X5R 1210; Manufacturer: Yageo; Item Type: Capacitors; Tolerance: 20%; Supplier: Future Electronics; LCSC Part Number: C326605; Manufacturer Part Number: CC1210MKX5R5BB107; RoHS: Yes; Stock: 155500; Pricing: 500=0.199, 1500=0.195, 2000=0.193, 5000=0.19, 7500=0.187 (USD); Mounting Technology: Surface Mount; Case/Package: 1210; Case Code (Imperial): 1210; Case Code (Metric): 3225; Weight: 0.000564oz; Min Operating Temperature: -55°C; Max Operating Temperature: 85°C; Value: 100uF; Packaging: Tape and Reel; Voltage Rating: 6.3V; Voltage Rating (DC): 6.3V; Dielectric: X5R; Termination: SMD/SMT; Series: CC; Length: 3.2mm; Width: 0.098inch; Height: 2.5mm; Thickness: 0.11inch; Depth: 2.5mm; Radiation Hardening: No; Lead Free: Lead Free; Halogen Free: Halogen Free; RoHS Compliant: Yes; ComponentLink1URL: http://www.mouser.com/ds/2/447/Yageo_UPY-GP_NP0_16V-to-50V_9-358835.pdf?src-supplier=Mouser; ComponentLink1Description: http://www.mouser.com/ds/2/447/Yageo_UPY-GP_NP0_16V-to-50V_9-358835.pdf?src-supplier=Mouser; ComponentLink2URL: https://www.verical.com/server-webapp/html/getDatasheet?partID=557130&src-supplier=Verical; ComponentLink2Description: https://www.verical.com/server-webapp/html/getDatasheet?partID=557130&src-supplier=Verical; ComponentLink3URL: http://www.yageo.com/documents/recent/UPY-GPHC_X5R_4V-to-50V_25.pdf?src-supplier=Digikey; ComponentLink3Description: http://www.yageo.com/documents/recent/UPY-GPHC_X5R_4V-to-50V_25.pdf?src-supplier=Digikey; ComponentLink4URL: http://www.yageo.com/documents/recent/UPY-GPHC_X5R_4V-to-50V_12.pdf?src-supplier=Avnet; ComponentLink4Description: http://www.yageo.com/documents/recent/UPY-GPHC_X5R_4V-to-50V_12.pdf?src-supplier=Avnet
L1 = ETQ-P3M6R8KVN: FIXED IND 6.8UH 4.5A 50.16 MOHM; Manufacturer: Panasonic; Item Type: Inductors; Value: 45.6mR; Supplier: Mouser; LCSC Part Number: C412310; Manufacturer Part Number: ETQ-P3M6R8KVN; RoHS: Yes; Stock: 4626; Pricing: 1=0.84, 10=0.609, 50=0.609, 100=0.502, 1000=0.405, 10000=0.344 (USD); ComponentLink1URL: http://www.farnell.com/datasheets/2820815.pdf?src-supplier=Farnell; ComponentLink1Description: http://www.farnell.com/datasheets/2820815.pdf?src-supplier=Farnell; ComponentLink2URL: https://industrial.panasonic.com/cdbs/www-data/pdf/AGL0000/AGL0000C63.pdf?src-supplier=Digikey; ComponentLink2Description: https://industrial.panasonic.com/cdbs/www-data/pdf/AGL0000/AGL0000C63.pdf?src-supplier=Digikey; ComponentLink3URL: https://datasheet.octopart.com/ETQ-P3M6R8KVN-Panasonic-datasheet-136412728.pdf?src-supplier=Element14; ComponentLink3Description: https://datasheet.octopart.com/ETQ-P3M6R8KVN-Panasonic-datasheet-136412728.pdf?src-supplier=Element14
LED5 = NCD0603R3: RED LED 0603 Light Emitting Diodes; Manufacturer: Foshan NationStar Optoelectronics; Manufacturer Part Number: NCD0603R3; Package: 0603; Item Type: LED; LCSC Part Number: C3151730; ComponentLink1Description: LCSC; ComponentLink1URL: https://www.lcsc.com/product-detail/Light-Emitting-Diodes-LED_Foshan-NationStar-Optoelectronics-NCD0603R3_C3151730.html
R12 R17 = RC0603FR-070RL: as R11 on sheet Microcontroller-Sheet; Manufacturer Part Number: RC0603FR-070RL; Package: 0603; LCSC Part Number: C100044; ComponentLink9Description: LCSC; ComponentLink9URL: https://www.lcsc.com/product-detail/Chip-Resistor-Surface-Mount_YAGEO-RC0603FR-070RL_C100044.html
R13 = RT0603BRD07511KL: RES SMD 511K OHM 0.1% 1/10W 0603; Manufacturer: Yageo; Item Type: Resistors; Value: 511kR; Power Rating: 100mW; Voltage Rating: 75V; Temperature Coefficient: 25ppm/°C; Supplier: Future Electronics; LCSC Part Number: C861454; Manufacturer Part Number: RT0603BRD07511KL; RoHS: Yes; Stock: 35000; Pricing: 5000=0.0176, 15000=0.0172, 20000=0.0171, 50000=0.0167, 75000=0.0164 (USD); Case/Package: 0603; Case Code (Imperial): 0603; Case Code (Metric): 1608; Weight: 7.1E-05oz; Min Operating Temperature: -55°C; Max Operating Temperature: 155°C; Packaging: Tape and Reel; Tolerance: 0.1%; Number of Terminations: 2; Termination: SMD/SMT; Max Power Dissipation: 100mW; Features: Moisture Resistant; Series: RT; Length: 0.063inch; Width: 0.8mm; Height: 0.022inch; RoHS Compliant: Yes; ComponentLink1URL: https://datasheet.ciiva.com/12810/pyu-rt-1-to-0-05-rohs-l-4-12810871.pdf?src-supplier=Mouser; ComponentLink1Description: https://datasheet.ciiva.com/12810/pyu-rt-1-to-0-05-rohs-l-4-12810871.pdf?src-supplier=Mouser
R14 = RC0603FR-0749R9L: RES 49.9 OHM 1% 1/10W 0603; Manufacturer: Yageo; Temperature Coefficient: 100ppm/°C; Voltage Rating (DC): 50V; Power Rating: 100mW; Item Type: Resistor; Supplier 1: Arrow Electronics; Manufacturer Part Number: RC0603FR-0749R9L; RoHS: Yes; Category: Chip SMD Resistors; Stock 1: 2075000; Pricing 1: 5000=0.00280 (USD); Case/Package: 0603; Number of Pins: 2; Case Code (Imperial): 0603; Case Code (Metric): 1608; Size Code: 0603; Min Operating Temperature: -55°C; Max Operating Temperature: 155°C; Tolerance: 1%; Resistance: 49.9R; Resistor Type: Thick Film; Packaging: Tape and Reel; Voltage Rating: 50V; Termination: SMD/SMT; Features: Moisture Resistant; Series: RC; Max Power Dissipation: 100mW; Number of Terminations: 2; Construction: Rectangular; Resistance Tolerance: 1%; Technology: THICK FILM; Length: 1.6mm; Height: 0.45mm; Depth: 0.8mm; Lead Free: Lead Free; REACH SVHC: No SVHC; Military Standard: Not; RoHS Compliant: Yes; ComponentLink1URL: https://datasheet.ciiva.com/11808/0900766b80f96399-11808223.pdf?src-supplier=RSComponents; ComponentLink1Description: https://datasheet.ciiva.com/11808/0900766b80f96399-11808223.pdf?src-supplier=RSComponents; ComponentLink2URL: https://datasheet.ciiva.com/22747/443971-22747527.pdf?src-supplier=Element14; ComponentLink2Description: https://datasheet.ciiva.com/22747/443971-22747527.pdf?src-supplier=Element14; ComponentLink3URL: https://datasheet.ciiva.com/15189/getdatasheetpartid-325421-15189750.pdf?src-supplier=Verical; ComponentLink3Description: https://datasheet.ciiva.com/15189/getdatasheetpartid-325421-15189750.pdf?src-supplier=Verical; Supplier Part Number 1: RC0603FR-0749R9L; LCSC Part Number: C114625
R15 = RT0603BRD0788K7L: RES SMD 88.7KOHM 0.1% 1/10W 0603; Manufacturer: Yageo; Item Type: Resistors; Power Rating: 100mW; Value: 88.7kR; Voltage Rating: 75V; Temperature Coefficient: 25ppm/°C; Voltage Rating (DC): 50V; Supplier: Future Electronics; LCSC Part Number: C728599; Manufacturer Part Number: RT0603BRD0788K7L; RoHS: Yes; Stock: 5000; Pricing: 5000=0.0186, 15000=0.0181, 20000=0.018, 50000=0.0177, 75000=0.0173 (USD); Case/Package: 0603; Case Code (Metric): 1608; Case Code (Imperial): 0603; Min Operating Temperature: -55°C; Max Operating Temperature: 155°C; Packaging: Tape and Reel; Tolerance: 0.1%; Number of Terminations: 2; Termination: SMD/SMT; Max Power Dissipation: 100mW; Series: RT; RoHS Compliant: Yes; Lead Free: 5697LeadFree; ComponentLink1URL: https://datasheet.ciiva.com/12702/pyu-rt-1-to-0-05-rohs-l-4-12702687.pdf?src-supplier=Mouser; ComponentLink1Description: https://datasheet.ciiva.com/12702/pyu-rt-1-to-0-05-rohs-l-4-12702687.pdf?src-supplier=Mouser
R16 = RT0603BRE0710K2L: RES SMD 10.2KOHM 0.1% 1/10W 0603; Manufacturer: Yageo; Item Type: Resistors; Supplier: Digikey; LCSC Part Number: C705802; Manufacturer Part Number: RT0603BRE0710K2L; RoHS: Yes; Stock: 23436; Pricing: 1=0.14, 10=0.106, 50=0.0826, 100=0.0734, 500=0.0561, 1000=0.04998 (USD); ComponentLink1URL: https://datasheet.ciiva.com/2584/pyu-rt-1-to-0-05-rohs-l-5-2584166.pdf?src-supplier=Digikey; ComponentLink1Description: https://datasheet.ciiva.com/2584/pyu-rt-1-to-0-05-rohs-l-5-2584166.pdf?src-supplier=Digikey
R18 = RT0603BRD0753K6L: RES SMD 53.6KOHM 0.1% 1/10W 0603; Manufacturer: Yageo; Item Type: Resistors; Value: 53.6kR; Power Rating: 100mW; Voltage Rating: 75V; Temperature Coefficient: 25ppm/°C; Voltage Rating (DC): 50V; Supplier: Digikey; LCSC Part Number: C861467; Manufacturer Part Number: RT0603BRD0753K6L; RoHS: Yes; Stock: 7280; Pricing: 1=0.12, 10=0.094, 50=0.0846, 100=0.0755, 500=0.05202, 1000=0.04794 (USD); Case/Package: 0603; Case Code (Imperial): 0603; Case Code (Metric): 1608; Weight: 7.1E-05oz; Min Operating Temperature: -55°C; Max Operating Temperature: 155°C; Packaging: Tape and Reel; Tolerance: 0.1%; Package Quantity: 5000; Termination: SMD/SMT; Number of Terminations: 2; Max Power Dissipation: 100mW; Series: RT; Length: 0.063inch; Width: 0.8mm; Height: 0.022inch; Lead Free: Lead Free; RoHS Compliant: Yes; ComponentLink1URL: https://datasheet.ciiva.com/12799/pyu-rt-1-to-0-05-rohs-l-4-12799848.pdf?src-supplier=Mouser; ComponentLink1Description: https://datasheet.ciiva.com/12799/pyu-rt-1-to-0-05-rohs-l-4-12799848.pdf?src-supplier=Mouser; ComponentLink2URL: https://datasheet.ciiva.com/46635/pyu-rt-1-to-0-05-rohs-l-5-46635002.pdf?src-supplier=Digikey; ComponentLink2Description: https://datasheet.ciiva.com/46635/pyu-rt-1-to-0-05-rohs-l-5-46635002.pdf?src-supplier=Digikey; ComponentLink3URL: https://datasheet.ciiva.com/2585/pyu-rt-1-to-0-05-rohs-l-4-2585995.pdf?src-supplier=Digikey; ComponentLink3Description: https://datasheet.ciiva.com/2585/pyu-rt-1-to-0-05-rohs-l-4-2585995.pdf?src-supplier=Digikey
R19 = RC0603FR-07680RL: as R7 on sheet Microcontroller-Sheet; Manufacturer Part Number: RC0603FR-07680RL; Package: 0603; ComponentLink4URL: https://www.lcsc.com/product-detail/Chip-Resistor-Surface-Mount_YAGEO-RC0603FR-07680RL_C112310.html; ComponentLink4Description: LCSC; LCSC Part Number: C112310
R20 = RC0603FR-07100KL: RES 100K OHM 1% 1/10W 0603; Manufacturer: Yageo; Item Type: Resistors; Value: 100kR; Temperature Coefficient: 100ppm/°C; Voltage Rating (DC): 50V; Power Rating: 100mW; Supplier: Rs; LCSC Part Number: C14675; Manufacturer Part Number: RC0603FR-07100KL; RoHS: Yes; Stock: 27300; Case/Package: 0603; Pins: 2; Case Code (Imperial): 0603; Case Code (Metric): 1608; Min Operating Temperature: -55°C; Max Operating Temperature: 155°C; Tolerance: 1%; Resistor Type: Thick Film; Packaging: Tape and Reel; Voltage Rating: 50V; Termination: SMD/SMT; Number of Terminations: 2; Features: Moisture Resistant; Series: RC; Max Power Dissipation: 100mW; Resistance Tolerance: 1%; Construction: Rectangular; Technology: THICK FILM; Length: 1.6mm; Width: 0.8mm; Height: 0.45mm; Depth: 0.8mm; Reach SVHC Compliant: No; Lead Free: 5697LeadFree; Military Standard: Not; RoHS Compliant: Yes; Supplier Part Number: 2424020; Category: Chip SMD Resistors; Mounting Technology: Surface Mount; Weight: 7.1E-05oz; Package Quantity: 5000; ComponentLink1URL: https://datasheet.ciiva.com/11819/0900766b80f96399-11819227.pdf?src-supplier=Rs; ComponentLink1Description: https://datasheet.ciiva.com/11819/0900766b80f96399-11819227.pdf?src-supplier=Rs; ComponentLink2URL: https://datasheet.ciiva.com/2455/pyu-r-int-thick-7-2455183.pdf?src-supplier=Digikey; ComponentLink2Description: https://datasheet.ciiva.com/2455/pyu-r-int-thick-7-2455183.pdf?src-supplier=Digikey; ComponentLink3URL: https://datasheet.ciiva.com/2455/pyu-r-int-thick-7-2455184.pdf?src-supplier=Digikey; ComponentLink3Description: https://datasheet.ciiva.com/2455/pyu-r-int-thick-7-2455184.pdf?src-supplier=Digikey; ComponentLink4URL: https://datasheet.ciiva.com/2455/pyu-r-int-thick-7-2455182.pdf?src-supplier=Digikey; ComponentLink4Description: https://datasheet.ciiva.com/2455/pyu-r-int-thick-7-2455182.pdf?src-supplier=Digikey
U2 = TPS62933DRLR: IC REG BUCK ADJ 3A SOT583; Manufacturer: Texas Instruments; Supplier: Mouser; Supplier Part Number: 595-TPS62933DRLR; Manufacturer Part Number: TPS62933DRLR; RoHS: No; Category: Voltage Regulators - Switching; Stock: 5259; Pricing: 1=0.7, 10=0.581, 50=0.581, 100=0.44, 1000=0.297, 10000=0.241 (USD); LCSC Part Number: C3200405; Item Type: IC
U3 = RT9080-33GJ5: TSOT-23-5 Linear Voltage Regulators (LDO) ROHS; Manufacturer: Richtek Tech; Item Type: IC; Manufacturer Part Number: RT9080-33GJ5; Package: TSOT-23-5; LCSC Part Number: C841192; ComponentLink1Description: LCSC; ComponentLink1URL: https://www.lcsc.com/product-detail/Linear-Voltage-Regulators-LDO_Richtek-Tech-RT9080-33GJ5_C841192.html

## Sheet Isolation-Sheet.SchDoc
size 420 x 297 mm; SheetNumber: 3; SheetTotal: 4
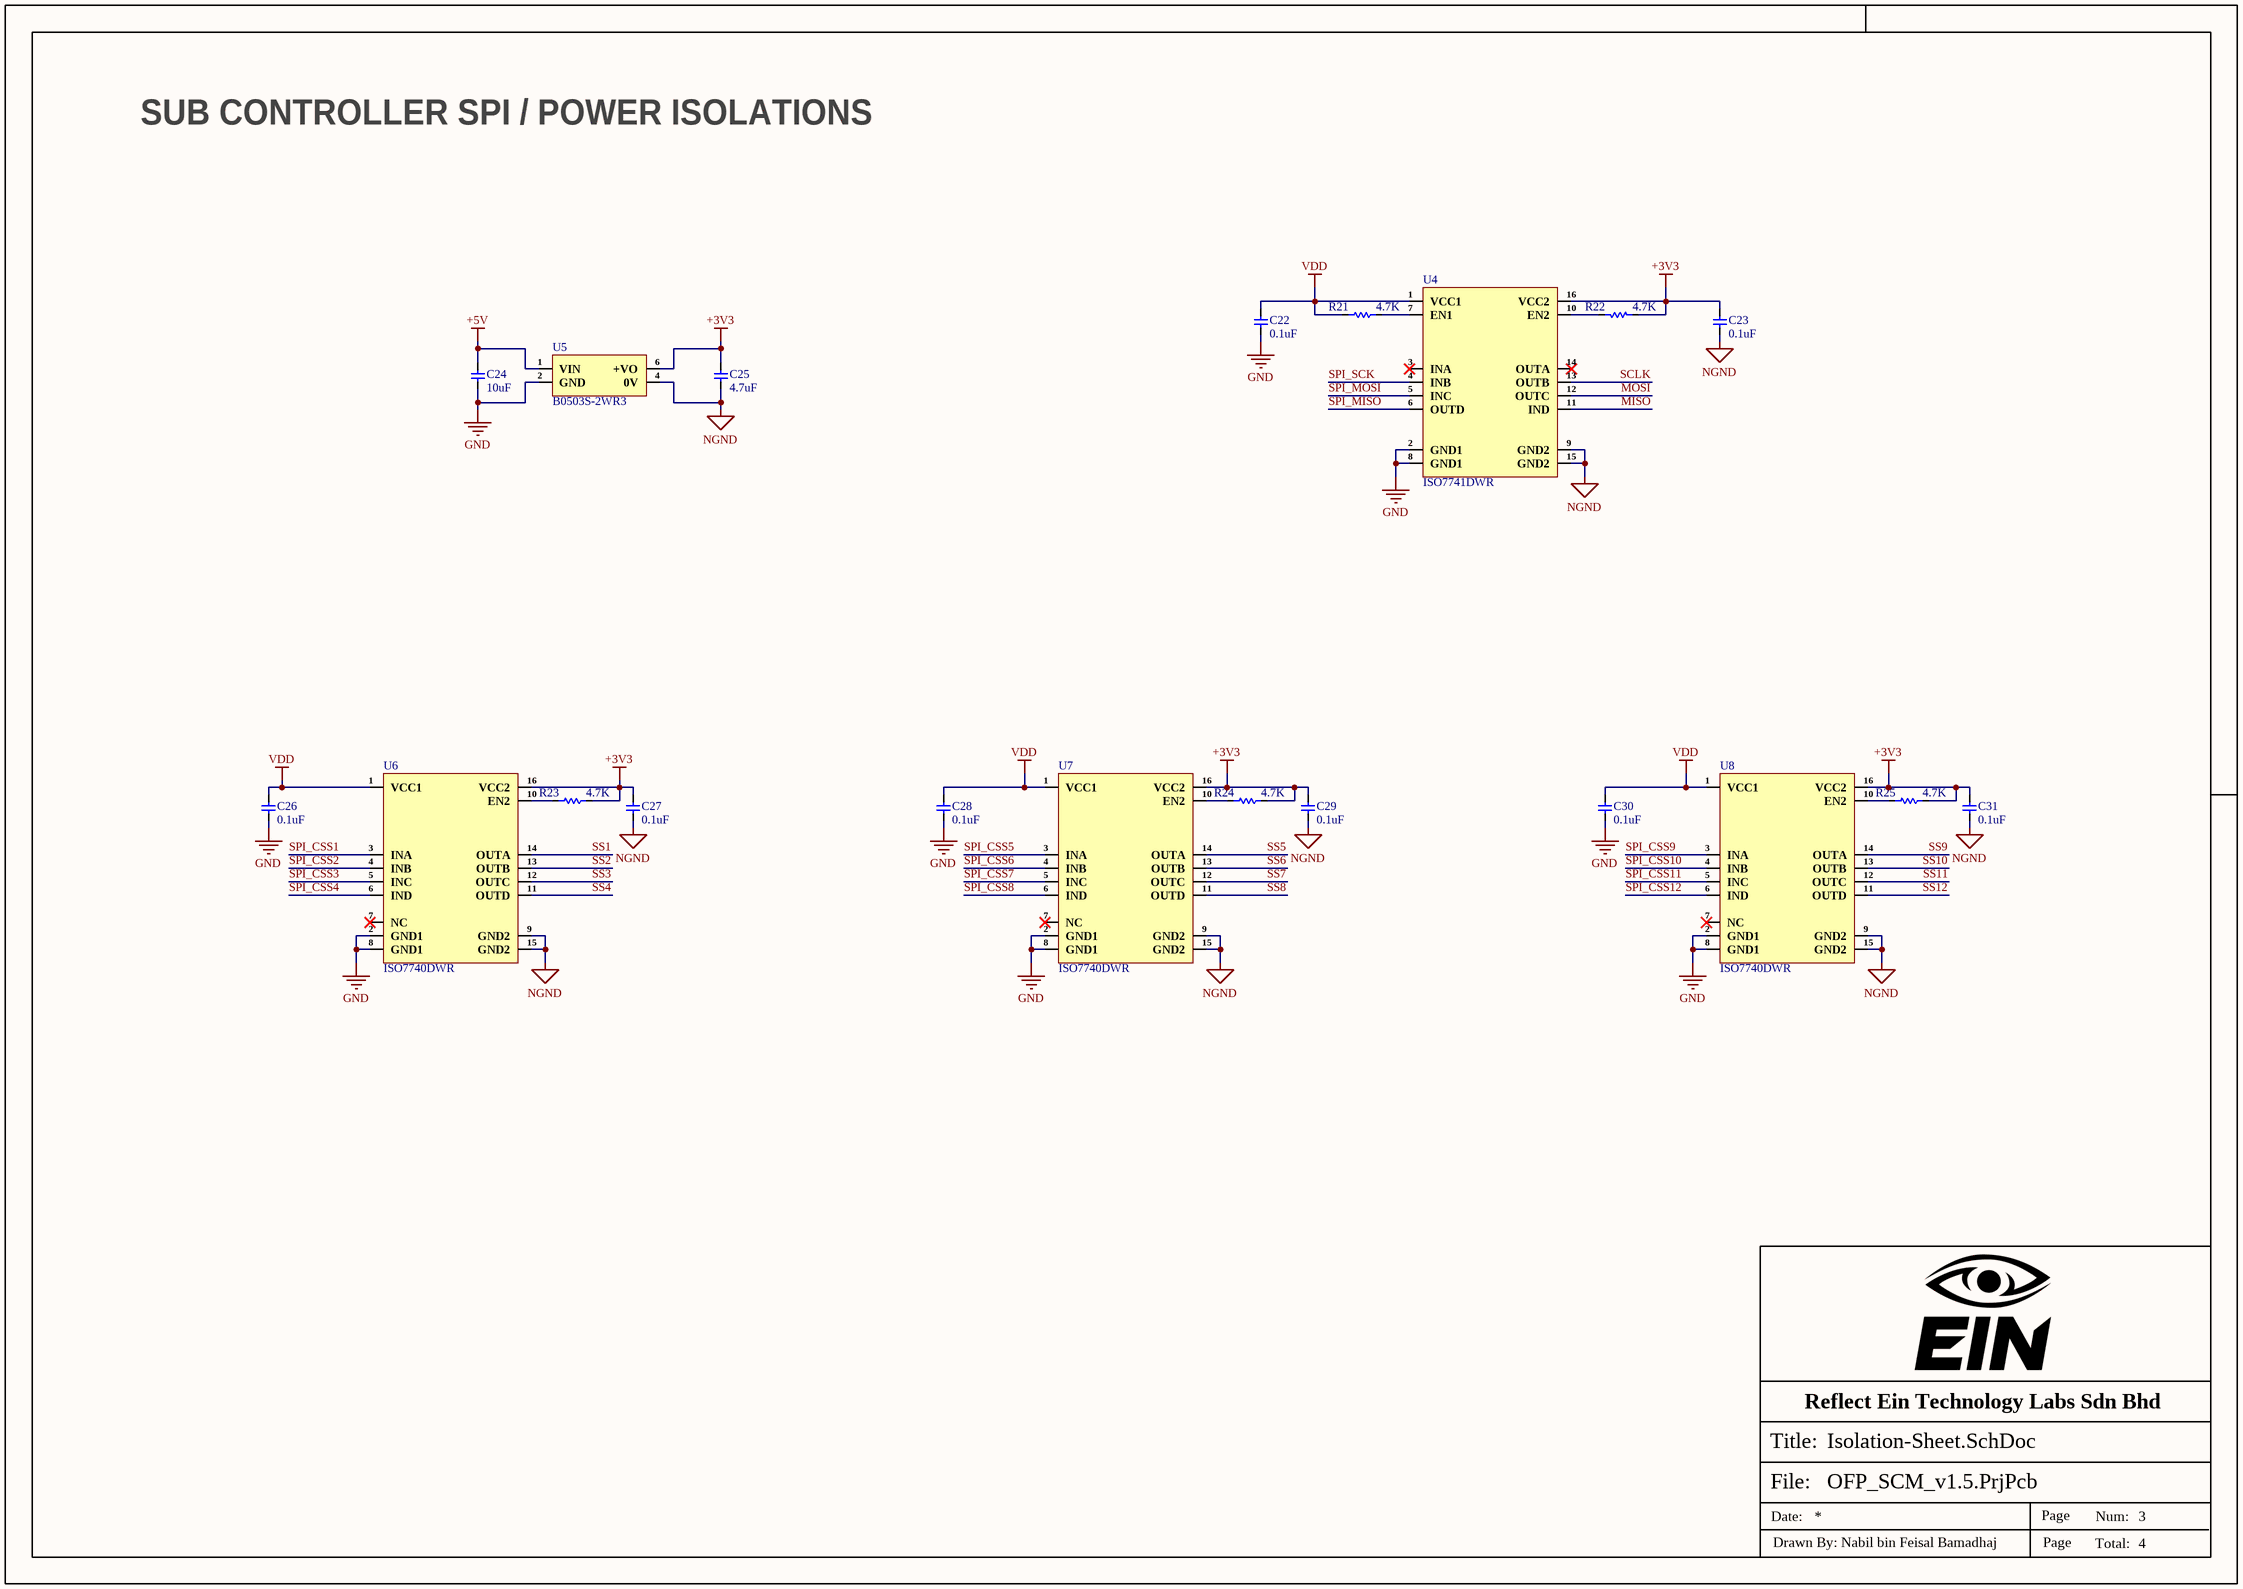
[diagram p2: Isolation-Sheet.SchDoc]

### Parts
C22  0.1uF  [Cap-0603]
C23  0.1uF  [Cap-0603]
C24  10uF  [Cap-0603]
C25  4.7uF  [Cap-0603]
C26  0.1uF  [Cap-0603]
C27  0.1uF  [Cap-0603]
C28  0.1uF  [Cap-0603]
C29  0.1uF  [Cap-0603]
C30  0.1uF  [Cap-0603]
C31  0.1uF  [Cap-0603]
R21  4.7K  [Res-0603]
R22  4.7K  [Res-0603]
R23  4.7K  [Res-0603]
R24  4.7K  [Res-0603]
R25  4.7K  [Res-0603]
U4  ISO7741DWR  [SOIC-16-300mil]
U5  B0503S-2WR3  [B0503S-2WR3]
U6  ISO7740DWR  [SOIC-16-300mil]
U7  ISO7740DWR  [SOIC-16-300mil]
U8  ISO7740DWR  [SOIC-16-300mil]

### Nets
+3V3: C23.2 C25.2 C27.2 C29.2 C31.2 R22.2 R23.1 R24.1 R25.1 U4.16(VCC2) U5.6(+VO) U6.16(VCC2) U7.16(VCC2) U8.16(VCC2)
+5V: C24.2 U5.1(VIN)
GND: C22.1 C24.1 C26.1 C28.1 C30.1 U4.2(GND1) U4.8(GND1) U5.2(GND) U6.2(GND1) U6.8(GND1) U7.2(GND1) U7.8(GND1) U8.2(GND1) U8.8(GND1)
NGND: C23.1 C25.1 C27.1 C29.1 C31.1 U4.9(GND2) U4.15(GND2) U5.4(0V) U6.9(GND2) U6.15(GND2) U7.9(GND2) U7.15(GND2) U8.9(GND2) U8.15(GND2)
VDD: C22.2 C26.2 C28.2 C30.2 R21.2 U4.1(VCC1) U6.1(VCC1) U7.1(VCC1) U8.1(VCC1)
MISO: U4.11(IND)
MOSI: U4.12(OUTC)
SCLK: U4.13(OUTB)
SPI_CSS1: U6.3(INA)
SPI_CSS2: U6.4(INB)
SPI_CSS3: U6.5(INC)
SPI_CSS4: U6.6(IND)
SPI_CSS5: U7.3(INA)
SPI_CSS6: U7.4(INB)
SPI_CSS7: U7.5(INC)
SPI_CSS8: U7.6(IND)
SPI_CSS9: U8.3(INA)
SPI_CSS10: U8.4(INB)
SPI_CSS11: U8.5(INC)
SPI_CSS12: U8.6(IND)
SPI_MISO: U4.6(OUTD)
SPI_MOSI: U4.5(INC)
SPI_SCK: U4.4(INB)
SS1: U6.14(OUTA)
SS2: U6.13(OUTB)
SS3: U6.12(OUTC)
SS4: U6.11(OUTD)
SS5: U7.14(OUTA)
SS6: U7.13(OUTB)
SS7: U7.12(OUTC)
SS8: U7.11(OUTD)
SS9: U8.14(OUTA)
SS10: U8.13(OUTB)
SS11: U8.12(OUTC)
SS12: U8.11(OUTD)
NetR21_1: R21.1 U4.7(EN1)
NetR22_1: R22.1 U4.10(EN2)
NetR23_2: R23.2 U6.10(EN2)
NetR24_2: R24.2 U7.10(EN2)
NetR25_2: R25.2 U8.10(EN2)

Not connected (* = marked no-connect by the designer): U4 3(INA)* 14(OUTA)*; U6 7(NC)*; U7 7(NC)*; U8 7(NC)*

### Notes on the sheet
- SUB CONTROLLER SPI / POWER ISOLATIONS
- Reflect Ein Technology Labs Sdn Bhd
- File:
- Title:
- Date:
- Page
- Num:
- Total:
- Drawn By: Nabil bin Feisal Bamadhaj

### Library data of the parts
C22 C23 C26-C31 = GCJ188R71H104KA12D: as C4 on sheet Microcontroller-Sheet; Supplier: Mouser; LCSC Part Number: C161115; Manufacturer Part Number: GCJ188R71H104KA12D; RoHS: Yes; Stock: 342536; Pricing: 1=0.13, 10=0.056, 50=0.056, 100=0.036, 1000=0.032, 10000=0.02 (USD); Mounting Technology: Surface Mount; Case/Package: 0603; Case Code (Metric): 1608; Case Code (Imperial): 0603; Min Operating Temperature: -55°C; Max Operating Temperature: 125°C; Dielectric: X7R; Package Quantity: 1; Voltage Rating: 50V; Packaging: Tape and Reel; Voltage Rating (DC): 50V; Termination: SMD/SMT; Features: Soft Termination; Series: GCJ; Construction: Flat; Length: 1.6mm; Width: 0.031inch; Height: 0.8mm; Thickness: 0.035inch; Depth: 0.8mm; Ratings: AEC-Q200; Radiation Hardening: No; RoHS Compliant: Yes; Lead Free: 5697LeadFree; ComponentLink1URL: https://datasheet.ciiva.com/135/product-135604.pdf?src-supplier=Digikey; ComponentLink1Description: https://datasheet.ciiva.com/135/product-135604.pdf?src-supplier=Digikey; ComponentLink2URL: https://datasheet.ciiva.com/26889/getdatasheetpartid-369886-26889118.pdf?src-supplier=Verical; ComponentLink2Description: https://datasheet.ciiva.com/26889/getdatasheetpartid-369886-26889118.pdf?src-supplier=Verical; ComponentLink3URL: https://datasheet.ciiva.com/135/s0717e-135605.pdf?src-supplier=Digikey; ComponentLink3Description: https://datasheet.ciiva.com/135/s0717e-135605.pdf?src-supplier=Digikey; ComponentLink4URL: https://datasheet.ciiva.com/135/s0717e-135606.pdf?src-supplier=Digikey; ComponentLink4Description: https://datasheet.ciiva.com/135/s0717e-135606.pdf?src-supplier=Digikey; ComponentLink5URL: https://datasheet.ciiva.com/16440/c03e-16440425.pdf?src-supplier=Future+Electronics; ComponentLink5Description: https://datasheet.ciiva.com/16440/c03e-16440425.pdf?src-supplier=Future+Electronics
C24 = GRM188Z71A106KA73D: as C1 on sheet Microcontroller-Sheet; Supplier: Mouser; LCSC Part Number: C2959727; Manufacturer Part Number: GRM188Z71A106KA73D; RoHS: Yes; Stock: 390983; Pricing: 1=0.36, 10=0.155, 50=0.155, 100=0.104, 1000=0.094, 10000=0.065 (USD); Case/Package: 345Case; Min Operating Temperature: -55°C; Max Operating Temperature: 125°C; Value: 10uF; Voltage Rating: 10V; Length: 1.6mm; Width: 800um; Height: 1mm; Thickness: 800um; RoHS Compliant: Yes; ComponentLink1URL: https://datasheet.octopart.com/GRM188Z71A106KA73D-Murata-datasheet-165579666.pdf?src-supplier=TME; ComponentLink1Description: https://datasheet.octopart.com/GRM188Z71A106KA73D-Murata-datasheet-165579666.pdf?src-supplier=TME
C25 = GRM188Z71A475KE15D: CAP CER 4.7UF 10V X7R 0603; Manufacturer: Murata; Item Type: Capacitors; Material: 4241ConductorMaterial; Tolerance: 10%; Supplier: Mouser; LCSC Part Number: C913474; Manufacturer Part Number: GRM188Z71A475KE15D; RoHS: Yes; Stock: 33218; Pricing: 1=0.24, 10=0.1, 50=0.1, 100=0.063, 1000=0.055, 10000=0.041 (USD); Case/Package: 0603; Min Operating Temperature: -55°C; Max Operating Temperature: 125°C; Value: 4.7uF; Voltage Rating: 10V; Length: 1.6mm; Width: 800um; Height: 950um; Thickness: 800um; RoHS Compliant: Yes; ComponentLink1URL: https://datasheet.octopart.com/GRM188Z71A475KE15D-Murata-datasheet-149523299.pdf?src-supplier=Newark; ComponentLink1Description: https://datasheet.octopart.com/GRM188Z71A475KE15D-Murata-datasheet-149523299.pdf?src-supplier=Newark; ComponentLink2URL: https://datasheet.octopart.com/GRM188Z71A475KE15D-Murata-datasheet-165579666.pdf?src-supplier=TME; ComponentLink2Description: https://datasheet.octopart.com/GRM188Z71A475KE15D-Murata-datasheet-165579666.pdf?src-supplier=TME
R21-R25 = RC0603FR-074K7L: as R4 on sheet Microcontroller-Sheet; Manufacturer Part Number: RC0603FR-074K7L; Package: 0603; ComponentLink7Description: LCSC; ComponentLink7URL: https://www.lcsc.com/product-detail/Chip-Resistor-Surface-Mount_YAGEO-RC0603FR-074K7L_C99782.html; LCSC Part Number: C99782
U4 = ISO7741DWR: DGTL ISO 5000VRMS 4CH GP 16SOIC; Manufacturer: Texas Instruments; Item Type: IC; Number of Channels: 4; Isolated Power: No; Channel Type: Unidirectional; Data Rate: 100Mbps; Propagation Delay: 16ns; Pulse Width Distortion (PWD): 4.9ns; Supplier: Mouser; LCSC Part Number: C571196; Manufacturer Part Number: ISO7741DWR; RoHS: Yes; Stock: 8750; Pricing: 1=2.32, 10=1.36, 50=1.36, 100=1.29, 1000=1.22, 10000=1.1 (USD); Mounting Technology: Surface Mount; Case/Package: SOIC; Pins: 16; Min Operating Temperature: -55°C; Max Operating Temperature: 125°C; Type: General Purpose; Series: -; Packaging: Cut Tape; Lead Free: Lead Free; RoHS Compliant: Yes; ComponentLink1URL: http://www.ti.com/lit/ds/symlink/iso7741.pdf?src-supplier=Digikey; ComponentLink1Description: http://www.ti.com/lit/ds/symlink/iso7741.pdf?src-supplier=Digikey; ComponentLink2URL: http://www.ti.com/general/docs/suppproductinfo.tsp?distId=10&amp;gotoUrl=http%3A%2F%2Fwww.ti.com%2Flit%2Fgpn%2Fiso7741&src-supplier=Digikey; ComponentLink2Description: http://www.ti.com/general/docs/suppproductinfo.tsp?distId=10&amp;gotoUrl=http%3A%2F%2Fwww.ti.com%2Flit%2Fgpn%2Fiso7741&src-supplier=Digikey
U5 = B0503S-2WR3: SIP-4 Isolated Power Modules ROHS; Manufacturer: YLPTEC; Item Type: Module; Manufacturer Part Number: B0503S-2WR3; Package: SIP-4; LCSC Part Number: C5369472; ComponentLink1Description: LCSC; ComponentLink1URL: https://www.lcsc.com/product-detail/Isolated-Power-Modules_YLPTEC-B0503S-2WR3_C5369472.html?s_z=n_B0503S-2WR3
U6-U8 = ISO7740DWR: DGTL ISO 5000VRMS 4CH GP 16SOIC; Manufacturer: Texas Instruments; Item Type: IC; Supplier: Mouser; LCSC Part Number: C529547; Manufacturer Part Number: ISO7740DWR; RoHS: Yes; Stock: 19329; Pricing: 1=2.71, 10=1.85, 50=1.85, 100=1.61, 1000=1.59, 10000=1.59 (USD); Length: 10.3mm; Width: 7.5mm; Height: 2.65mm; Thickness: 2.35mm; Lead Free: 5697LeadFree; ComponentLink1URL: http://www.ti.com/general/docs/lit/getliterature.tsp?genericPartNumber=ISO7740&fileType=pdf&src-supplier=Farnell; ComponentLink1Description: http://www.ti.com/general/docs/lit/getliterature.tsp?genericPartNumber=ISO7740&fileType=pdf&src-supplier=Farnell; ComponentLink2URL: http://www.ti.com/lit/ds/symlink/iso7741.pdf?src-supplier=Digikey; ComponentLink2Description: http://www.ti.com/lit/ds/symlink/iso7741.pdf?src-supplier=Digikey; ComponentLink3URL: http://www.farnell.com/datasheets/2113498.pdf?src-supplier=Element14; ComponentLink3Description: http://www.farnell.com/datasheets/2113498.pdf?src-supplier=Element14; ComponentLink4URL: http://www.ti.com/general/docs/suppproductinfo.tsp?distId=10&amp;gotoUrl=http%3A%2F%2Fwww.ti.com%2Flit%2Fgpn%2Fiso7741&src-supplier=Digikey; ComponentLink4Description: http://www.ti.com/general/docs/suppproductinfo.tsp?distId=10&amp;gotoUrl=http%3A%2F%2Fwww.ti.com%2Flit%2Fgpn%2Fiso7741&src-supplier=Digikey